# Altium schematic sheet Field_IO.SchDoc
size A4
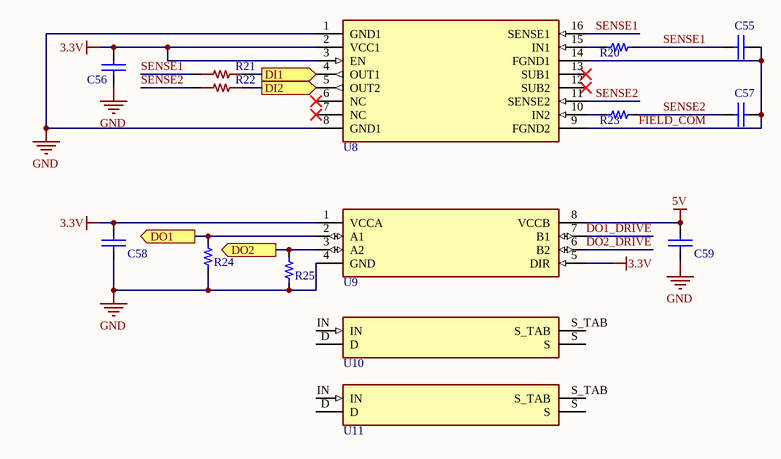
[diagram p0: Field_IO.SchDoc]

## Parts
C55  10 nF  [GW_CAND_0603_cap]  (value not drawn)
C56  100 nF  [GW_CAND_0603_cap]  (value not drawn)
C57  10 nF  [GW_CAND_0603_cap]  (value not drawn)
C58  100 nF  [GW_CAND_0603_cap]  (value not drawn)
C59  100 nF  [GW_CAND_0603_cap]  (value not drawn)
R20  562 Ohm  [GW_CAND_0603_res]  (value not drawn)
R21  MM204F1K00TKRTR3K0  [GW_MM204_FIRSTOHM]  (value not drawn)
R22  MM204F1K00TKRTR3K0  [GW_MM204_FIRSTOHM]  (value not drawn)
R23  562 Ohm  [GW_CAND_0603_res]  (value not drawn)
R24  10 kOhm  [GW_CAND_0603_res]  (value not drawn)
R25  10 kOhm  [GW_CAND_0603_res]  (value not drawn)
U8  ISO1212DBQR  [GW_DBQ0016A_TI]  (value not drawn)
U9  SN74LVC2T45DCTR  [GW_DCT0008A_TI]  (value not drawn)
U10  BSP75NTA  [GW_BSP75N_SOT223_DN_DIODES]  (value not drawn)
U11  BSP75NTA  [GW_BSP75N_SOT223_DN_DIODES]  (value not drawn)

## Ports
DI1 (out), DI2 (out), DO1 (out), DO2 (out)

## Nets
3.3V: C56.1 C58.1 U8.2(VCC1) U8.3(EN) U9.1(VCCA) U9.5(DIR)
5V: C59.1 U9.8(VCCB)
GND: C56.2 C58.2 C59.2 R24.1 R25.1 U8.1(GND1) U8.8(GND1) U9.4(GND)
DI1: R21.2 U8.4(OUT1) ; port DI1
DI2: R22.2 U8.5(OUT2) ; port DI2
DO1: R24.2 U9.2(A1) ; port DO1
DO1_DRIVE: U9.7(B1)
DO2: R25.2 U9.3(A2) ; port DO2
DO2_DRIVE: U9.6(B2)
FIELD_COM: C55.2 C57.2 U8.9(FGND2) U8.14(FGND1)
SENSE1: C55.1 R20.2 R21.1 U8.16(SENSE1)
SENSE2: C57.1 R22.1 R23.2 U8.11(SENSE2)
NetR20_1: R20.1 U8.15(IN1)
NetR23_1: R23.1 U8.10(IN2)

Not connected (* = marked no-connect by the designer): U8 6(NC)* 7(NC)* 12(SUB2)* 13(SUB1)*; U10 D IN S S_TAB; U11 D IN S S_TAB

## Library data of the parts
C55 C57 = GW_C0603C103K1RACTU_97f3ee33: C0603C103K1RACTU; 10 nF; 100 V; X7R; -55..125 C; CAD_CANDIDATE; Manufacturer: KEMET; Tolerance: 10%; Electrical_Status: PROVISIONAL; CAD_Source: Professor_shared.SchLib glyph Cap_0.1uF_0603_50V; CAD_Limitations: Glyph pins/types inspected; exact manufacturer land-pattern/mask/paste qualification pending.; Electrical_Notes: Ficha KEMET local DI_CIN p1; no confundir con externo CL10B103KA8WPNC 25 V. Modelo candidato existente; sin cotejo visual de pads/pines en Altium.; Manufacturer Part Number: C0603C103K1RACTU; Value: 10 nF; Rating: 100 V; X7R; -55..125 C; Power Rating: N/A; Package: 0603; CAD_Status: CAD_CANDIDATE
C56 C58 C59 = GW_C0603C104K5RACTU_dc5e12a5: C0603C104K5RACTU; 100 nF; 50 V; X7R; -55..125 C; CAD_CANDIDATE; Manufacturer: KEMET; Tolerance: 10%; Electrical_Status: PROVISIONAL; CAD_Source: Professor_shared.SchLib glyph Cap_0.1uF_0603_50V; CAD_Limitations: Glyph pins/types inspected; exact manufacturer land-pattern/mask/paste qualification pending.; Electrical_Notes: Ficha KEMET local p1. Adaptar parametros; no usar el Y5V 0603F104Z500CT como equivalente. Modelo candidato existente; sin cotejo visual de pads/pines en Altium.; Manufacturer Part Number: C0603C104K5RACTU; Value: 100 nF; Rating: 50 V; X7R; -55..125 C; Power Rating: N/A; Package: 0603; CAD_Status: CAD_CANDIDATE
R20 R23 = GW_RC0603FR-07562RL_a6fad8df: RC0603FR-07562RL; 562 Ohm; 75 V max; limite sqrt(P*R); CAD_CANDIDATE; Manufacturer: Yageo; Tolerance: 1%; Power Rating: 0.1 W @70 C; Electrical_Status: PROVISIONAL; CAD_Source: Professor_shared.SchLib glyph Res_10k_0603_1/10W; CAD_Limitations: Glyph pins/types inspected; exact manufacturer land-pattern/mask/paste qualification pending.; Electrical_Notes: Ityp2.25mA; P conservadora a2.75mA=4.30mW. No es resistor de24V completos; corriente de campo separada deVCC1. Modelo candidato existente; sin cotejo visual de pads/pines en Altium.; Manufacturer Part Number: RC0603FR-07562RL; Value: 562 Ohm; Rating: 75 V max; limite sqrt(P*R); Package: 0603; CAD_Status: CAD_CANDIDATE
R21 R22 = MM204F1K00TKRTR3K0: Firstohm MM rev08-March-2023 printedpp75-78; p78 reflow pad table MM16/MM204; 1kOhm1%,0.25W@70C; normal Type3 operation supported. 500V/1kV system surge withstand NOT established.; CAD Status: CAD_CANDIDATE; Manufacturer: Firstohm; Manufacturer Part Number: MM204F1K00TKRTR3K0; Source: Firstohm MM rev08-March-2023 printedpp75-78; p78 reflow pad table MM16/MM204; Limitations: 1kOhm1%,0.25W@70C; normal Type3 operation supported. 500V/1kV system surge withstand NOT established.
R24 R25 = GW_FRC0603J103TS_7289f91d: FRC0603J103TS; 10 kOhm; >= 3.3 V; tension de trabajo por verificar; CAD_CANDIDATE; Manufacturer: FOJAN; Tolerance: 5%; Power Rating: 0.1 W; Electrical_Status: PROVISIONAL; CAD_Source: Professor_shared.SchLib glyph Res_10k_0603_1/10W; CAD_Limitations: Glyph pins/types inspected; exact manufacturer land-pattern/mask/paste qualification pending.; Electrical_Notes: Ratings transcritos del CAD; falta ficha FOJAN. Alternativa RC0603FR-0710KL con ficha oficial local, mismo footprint candidato. Modelo candidato existente; sin cotejo visual de pads/pines en Altium.; Manufacturer Part Number: FRC0603J103TS; Value: 10 kOhm; Rating: >= 3.3 V; tension de trabajo por verificar; Package: 0603; CAD_Status: CAD_CANDIDATE
U8 = ISO1212DBQR: ISO1212DBQR; CAD_CANDIDATE; SUB12 and SUB13 must remain separate floating nets. TI recommends an individual 2x2mm floating copper island for each; these board-level islands are NOT encoded in this package footprint. Never join to either FGND, GND1 or each; Manufacturer: Texas Instruments; Electrical_Status: PROVISIONAL; CAD_Source: SLLSEY7G table4-2 p4; DBQ0016A 4214846/A PDF pp44-46; CAD_Limitations: SUB12 and SUB13 must remain separate floating nets. TI recommends an individual 2x2mm floating copper island for each; these board-level islands are NOT encoded in this package footprint. Never join to either FGND, GND1 or each other. NC6/7 unconnected.; Manufacturer Part Number: ISO1212DBQR; Value: ISO1212DBQR; CAD_Status: CAD_CANDIDATE
U9 = SN74LVC2T45DCTR: SN74LVC2T45DCTR; CAD_CANDIDATE; Electrical candidate only; no OE pin. VOH at BSP75N input load remains open.; Manufacturer: Texas Instruments; Electrical_Status: PROVISIONAL; CAD_Source: SCES516N table4-1 p2; DCT0008A 4220784/D PDF pp28-30; Manufacturer Part Number: SN74LVC2T45DCTR; Value: SN74LVC2T45DCTR; CAD_Status: CAD_CANDIDATE; CAD_Limitations: Electrical candidate only; no OE pin. VOH at BSP75N input load remains open.
U10 U11 = BSP75NTA: BSP75NTA smart low-side switch; physical terminal positions and Diodes land pattern verified; IN,D,S,S_TAB identifiers; driver VOH acceptance remains pending.; Manufacturer: Diodes Incorporated; CAD_Status: CAD_BLOCKED; Electrical_Status: PROVISIONAL; CAD_Source: Diodes DS33016 Rev7-2 pp1,8; terminal numbering absent; CAD_Limitations: CAD_BLOCKED: terminal identifiers are role names, not manufacturer numbers. Tab=Source, isolated from Drain. Need exact numbered Type DN drawing/model before any placement or footprint binding.; CAD Status: CAD_VERIFIED; Limitations: Physical mapping verified from Diodes top view: with tab above, left IN, middle D, right S; tab S_TAB=Source. No manufacturer numeric pin IDs asserted. Loaded driver VOH and startup OFF not yet verified.; Electrical Approval: ELECTRICAL_BLOCKED_DRIVER_VOLTAGE_PENDING; Physical Mapping: IN left lower;D center lower;S right lower;S_TAB upper tab;Top View; Manufacturer Part Number: BSP75NTA; Value: BSP75NTA; Source: Diodes DS33016 Rev7-2 Jan2024 p1 Top View Pin Out, p8 Suggested Pad Layout; functional pad identifiers preserve original symbol pins; Datasheet: sources/bsp75n_closure/BSP75N.pdf